# Altium schematic sheet BLE-Section.SchDoc
size A4; SheetNumber: 6; SheetTotal: 11
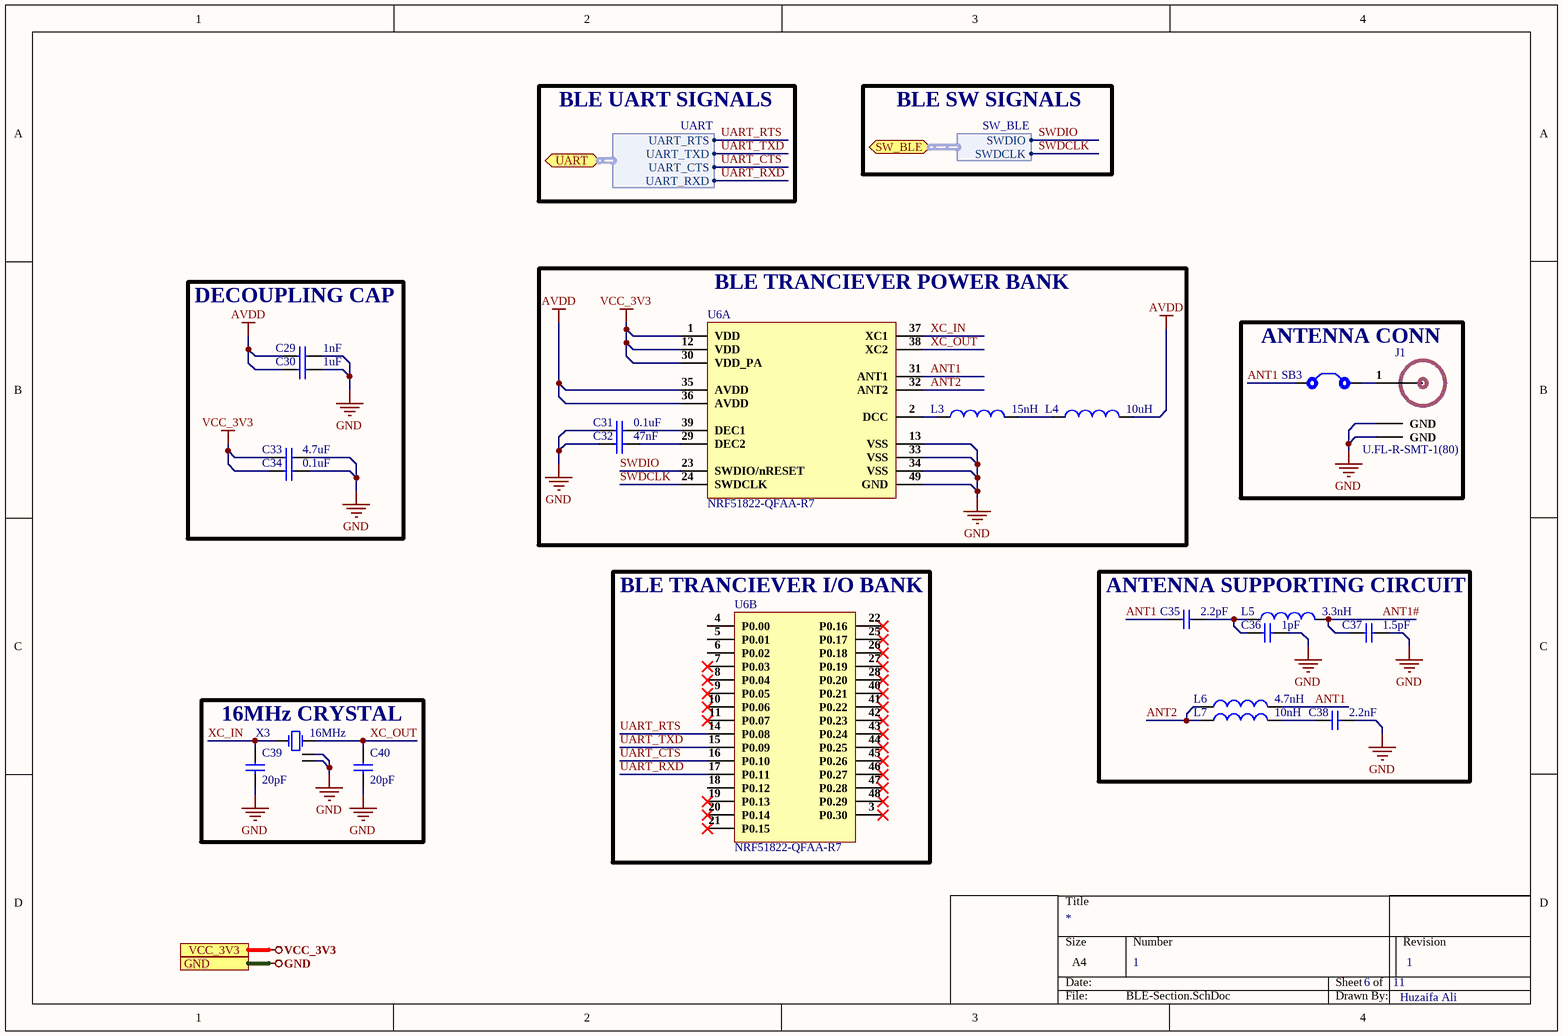
[diagram p0: BLE-Section.SchDoc]

## Parts
C29  1nF  [Cap 0402]
C30  1uF  [Cap 0402]
C31  0.1uF  [Cap 0402]
C32  47nF  [Cap 0402]
C33  4.7uF  [Cap 0402]
C34  0.1uF  [Cap 0402]
C35  2.2pF  [Cap 0402]
C36  1pF  [Cap 0402]
C37  1.5pF  [Cap 0402]
C38  2.2nF  [Cap 0402]
C39  20pF  [Cap 0402]
C40  20pF  [Cap 0402]
J1  U.FL-R-SMT-1(80)  [U.FL-R-SMT-1(80)]
L3  15nH  [SCW1608C15NJST]
L4  10uH  [Ind0805]
L5  3.3nH  [IND 0603]
L6  4.7nH  [IND 0603]
L7  10nH  [MHQ1005P10NGT000]
SB3  Solder Bridge  [Solder Bridge]  (value not drawn)
U6  NRF51822-QFAA-R7  [48-QFN (6x6)]  (parts A,B of 2)
X3  16MHz  [X322516MOB4SI]

## Blocks framed on the sheet
DECOUPLING CAP: C29 C30 C33 C34
BLE TRANCIEVER POWER BANK: C31 C32 L3 L4 U6
ANTENNA CONN: J1 SB3
BLE TRANCIEVER I/O BANK: U6
ANTENNA SUPPORTING CIRCUIT: C35-C38 L5-L7
16MHz CRYSTAL: C39 C40 X3

## Ports
GND, SW_BLE (bidir, harness SW_BLE), UART (bidir, harness UART), VCC_3V3

## Harnesses
SW_BLE: SWDIO, SWDCLK
UART: UART_RTS, UART_TXD, UART_CTS, UART_RXD

## Nets
AVDD: C29.1 C30.1 L4.2 U6.35(AVDD) U6.36(AVDD)
GND: C29.2 C30.2 C31.1 C32.1 C33.2 C34.2 C36.2 C37.2 C38.2 C39.1 C40.1 J1.2(GND) J1.3(GND) U6.13(VSS) U6.33(VSS) U6.34(VSS) U6.49(GND) X3.2(GND) X3.4(GND) ; port GND
VCC_3V3: C33.1 C34.1 U6.1(VDD) U6.12(VDD) U6.30(VDD_PA) ; port VCC_3V3
ANT1: C35.1 L6.2 SB3.1 U6.31(ANT1)
ANT1#: C37.1 L5.2
ANT2: L6.1 L7.1 U6.32(ANT2)
SWDCLK: U6.24(SWDCLK) ; port SW_BLE.SWDCLK
SWDIO: U6.23(SWDIO/nRESET) ; port SW_BLE.SWDIO
UART_CTS: U6.16(P0.10) ; port UART.UART_CTS
UART_RTS: U6.14(P0.08) ; port UART.UART_RTS
UART_RXD: U6.17(P0.11) ; port UART.UART_RXD
UART_TXD: U6.15(P0.09) ; port UART.UART_TXD
XC_IN: C39.2 U6.37(XC1) X3.1(OSC1)
XC_OUT: C40.2 U6.38(XC2) X3.3(OSC2)
NetC31_2: C31.2 U6.39(DEC1)
NetC32_2: C32.2 U6.29(DEC2)
NetC35_2: C35.2 C36.1 L5.1
NetC38_1: C38.1 L7.2
NetJ1_1: J1.1(RF_IN) SB3.2
NetL3_1: L3.1 U6.2(DCC)
NetL3_2: L3.2 L4.1

Not connected (* = marked no-connect by the designer): U6 3(P0.30)* 4(P0.00) 5(P0.01) 6(P0.02) 7(P0.03)* 8(P0.04)* 9(P0.05)* 10(P0.06)* 11(P0.07)* 18(P0.12) 19(P0.13)* 20(P0.14)* 21(P0.15)* 22(P0.16)* 25(P0.17)* 26(P0.18)* 27(P0.19)* 28(P0.20)* 40(P0.21)* 41(P0.22)* 42(P0.23)* 43(P0.24)* 44(P0.25)* 45(P0.26)* 46(P0.27)* 47(P0.28)* 48(P0.29)*

## Notes on the sheet
- BLE UART SIGNALS
- BLE SW SIGNALS
- 1
- Huzaifa Ali

## Library data of the parts
C29 = CC0402KRX7R8BB102: 0402 1 nF 25 V ±10 % Tolerance X7R SMT Multilayer Ceramic Capacitor; Manufacturer: Yageo; Manufacturer Part Number: CC0402JRNPO9BN200; Capacitance: 20pF; Tolerance: 5%; Voltage Rating: 50V; Dielectric: C0G; Dissipation Factor: 2.5%; Insulation Resistance: 10GR; Supplier 1: Digi-Key; Stock 1: 453493; Pricing 1: 1=0.1, 10=0.036, 100=0.0162, 500=0.01156, 1000=0.00908, 2500=0.00825, 5000=0.00759 (USD); Mount: Surface Mount; Case/Package: 0402; Number of Pins: 2; Weight: 2.3E-05oz; Case Code (Metric): 1005; Case Code (Imperial): 0402; Min Operating Temperature: -55°C; Max Operating Temperature: 125°C; Packaging: Tape and Reel; Package Quantity: 1; Voltage Rating (DC): 50V; Termination: SMD/SMT; Composition: Ceramic; Length: 1mm; Width: 0.02inch; Thickness: 0.022inch; Depth: 0.5mm; REACH SVHC: No SVHC; Lead Free: Lead Free; ComponentLink1URL: http://www.yageo.com/documents/recent/UPY-GP_NP0_16V-to-50V_16.pdf?src-supplier=Digi-Key; ComponentLink1Description: http://www.yageo.com/documents/recent/UPY-GP_NP0_16V-to-50V_16.pdf?src-supplier=Digi-Key; ComponentLink2URL: http://www.yageo.com/documents/recent/UPY-GP_NP0_16V-to-50V_16.pdf?src-supplier=Mouser; ComponentLink2Description: http://www.yageo.com/documents/recent/UPY-GP_NP0_16V-to-50V_16.pdf?src-supplier=Mouser; Supplier Part Number 1: 311-1417-1-ND; Supplier 2: Digi-Key; RoHS: Yes; Category: Ceramic Capacitors; Stock 2: 503749; Pricing 2: 1=0.10000, 10=0.02400, 50=0.01340, 100=0.01090, 500=0.00778, 1000=0.00611, 2500=0.00556, 5000=0.00511 (USD); Series: CC; Radiation Hardening: No; Halogen Free: Halogen Free; RoHS Compliant: Yes; ComponentLink3URL: https://datasheet.ciiva.com/26862/getdatasheetpartid-639817-26862638.pdf?src-supplier=Verical; ComponentLink3Description: https://datasheet.ciiva.com/26862/getdatasheetpartid-639817-26862638.pdf?src-supplier=Verical; ComponentLink4URL: https://datasheet.ciiva.com/5425/upy-gp-np0-16v-to-50v-8-3714-5425527.pdf?src-supplier=Mouser; ComponentLink4Description: https://datasheet.ciiva.com/5425/upy-gp-np0-16v-to-50v-8-3714-5425527.pdf?src-supplier=Mouser; Supplier Part Number 2: 311-1712-1-ND
C30 = CC0402KRX5R7BB105: CAP CER 1UF 16V X5R 0402; Manufacturer: Yageo; Tolerance: 10%; Supplier 1: Digi-Key; Manufacturer Part Number: CC0402KRX5R7BB105; Stock 1: 1405667; Pricing 1: 1=0.36, 10=0.252, 100=0.1512, 500=0.1134, 1000=0.09576, 2500=0.09072, 5000=0.08568 (USD); Mount: Surface Mount; Case/Package: 0402; Weight: 2.3E-05oz; Case Code (Imperial): 0402; Case Code (Metric): 1005; Min Operating Temperature: -55°C; Max Operating Temperature: 85°C; Capacitance: 1uF; Dielectric: X5R; Packaging: Tape and Reel; Voltage Rating (DC): 16V; Voltage Rating: 16V; Termination: SMD/SMT; Composition: Ceramic; Length: 1mm; Height: 0.5mm; Width: 0.02inch; Thickness: 0.022inch; Depth: 0.5mm; Radiation Hardening: No; Lead Free: Lead Free; Halogen Free: Halogen Free; ComponentLink1URL: http://www.yageo.com/documents/recent/UPY-GPHC_X5R_4V-to-50V_12.pdf?src-supplier=Avnet+Europe; ComponentLink1Description: http://www.yageo.com/documents/recent/UPY-GPHC_X5R_4V-to-50V_12.pdf?src-supplier=Avnet+Europe; Supplier Part Number 1: 311-1691-6-ND
C31 C34 = GRM155R71H104ME14D: CAP CER 0.1UF 50V X7R 0402; Manufacturer: Murata; Tolerance: 20%; Capacitance: 100nF; Supplier 1: Digi-Key; Manufacturer Part Number: GRM155R71H104ME14D; Stock 1: 439844; Pricing 1: 1=0.1, 10=0.038, 100=0.0168, 500=0.01198, 1000=0.00941, 2500=0.00855, 5000=0.00787 (USD); Mount: Surface Mount; Case/Package: 0402; Min Operating Temperature: -55°C; Max Operating Temperature: 125°C; Packaging: Cut Tape; Voltage Rating: 50V; Length: 0.039inch; Width: 0.02inch; Thickness: 0.022inch; ComponentLink1URL: http://search.murata.co.jp/Ceramy/image/img/A01X/G101/ENG/GRM155R71H104ME14-01.pdf?src-supplier=Digi-Key; ComponentLink1Description: http://search.murata.co.jp/Ceramy/image/img/A01X/G101/ENG/GRM155R71H104ME14-01.pdf?src-supplier=Digi-Key; ComponentLink2URL: http://psearch.en.murata.com/capacitor/product/GRM155R71H104ME14%23.pdf?src-supplier=Avnet; ComponentLink2Description: http://psearch.en.murata.com/capacitor/product/GRM155R71H104ME14%23.pdf?src-supplier=Avnet; ComponentLink3URL: http://components.arrow.com/part/dataview/0323_07177683?src-supplier=Arrow+Europe; ComponentLink3Description: http://components.arrow.com/part/dataview/0323_07177683?src-supplier=Arrow+Europe; ComponentLink4URL: http://www.mouser.com/ds/2/281/c02e-2905.pdf?src-supplier=Mouser; ComponentLink4Description: http://www.mouser.com/ds/2/281/c02e-2905.pdf?src-supplier=Mouser; Supplier Part Number 1: 490-10701-1-ND
C32 = C1005X7R473METS: 16V 47nF X7R ±20% 0402 Multilayer Ceramic Capacitors MLCC - SMD/SMT ROHS; Manufacture: Darfon Elec; ComponentLink1URL: http://www.yageo.com/documents/recent/UPY-GP_NP0_16V-to-50V_16.pdf?src-supplier=Digi-Key; ComponentLink1Description: http://www.yageo.com/documents/recent/UPY-GP_NP0_16V-to-50V_16.pdf?src-supplier=Digi-Key; ComponentLink2URL: http://www.yageo.com/documents/recent/UPY-GP_NP0_16V-to-50V_16.pdf?src-supplier=Mouser; ComponentLink2Description: http://www.yageo.com/documents/recent/UPY-GP_NP0_16V-to-50V_16.pdf?src-supplier=Mouser; ComponentLink3URL: http://www.mouser.com/ds/2/281/c02e-2905.pdf?src-supplier=Mouser; ComponentLink3Description: http://www.mouser.com/ds/2/281/c02e-2905.pdf?src-supplier=Mouser; ComponentLink4URL: http://search.murata.co.jp/Ceramy/image/img/A01X/G101/ENG/GRM155R61E225KE11-01.pdf?src-supplier=Digi-Key; ComponentLink4Description: http://search.murata.co.jp/Ceramy/image/img/A01X/G101/ENG/GRM155R61E225KE11-01.pdf?src-supplier=Digi-Key; ComponentLink5URL: http://search.murata.co.jp/Ceramy/image/img/A01X/partnumbering_e_01.pdf?src-supplier=Digi-Key; ComponentLink5Description: http://search.murata.co.jp/Ceramy/image/img/A01X/partnumbering_e_01.pdf?src-supplier=Digi-Key; ComponentLink6URL: http://psearch.en.murata.com/capacitor/product/GRM155R61E225KE11%23.pdf?src-supplier=Avnet; ComponentLink6Description: http://psearch.en.murata.com/capacitor/product/GRM155R61E225KE11%23.pdf?src-supplier=Avnet; Manufacturer Part no:: C1005X7R473METS; Package: Cap 0402`; Value: 47nF
C33 = EDK105BBJ475MVLF: 16V 4.7uF ±20% 0402 Multilayer Ceramic Capacitors MLCC
C35 = GCM1555C1H2R2WA16D: CAP CER 2.2PF 50VDC C0G 0.05PF SMD 0402; Manufacturer: Murata; Supplier 1: Mouser; Manufacturer Part Number: GCM1555C1H2R2WA16D; RoHS: Yes; Category: Ceramic Capacitors; Stock 1: 14337; Pricing 1: 1=0.23000, 10=0.15400, 50=0.15400, 100=0.07900, 1000=0.04800, 10000=0.03900 (USD); RoHS Compliant: Yes; Supplier Part Number 1: 81-GCM1555C1H2R2WA6D
C36 = GRM1555C1H1R0CA01D: 0402 1 pF 50 V ±0.25 pF Tolerance C0G SMT Multilayer Ceramic Capacitor; Manufacturer: Murata; Voltage Rating: 50V; Supplier 1: Digi-Key; Manufacturer Part Number: GRM1555C1H1R0CA01D; RoHS: Yes; Category: Ceramic Capacitors; Stock 1: 594883; Pricing 1: 1=0.10000, 10=0.02200, 50=0.01200, 100=0.00980, 500=0.00700, 1000=0.00551, 2500=0.00500, 5000=0.00460 (USD); Mount: Surface Mount; Case/Package: 0402; Case Code (Metric): 1005; Case Code (Imperial): 0402; Material: Ceramic; Min Operating Temperature: -55°C; Max Operating Temperature: 125°C; Package Quantity: 1; Capacitance: 1pF; Packaging: Tape and Reel; Voltage Rating (DC): 50V; Dielectric: C0G; Termination: SMD/SMT; Voltage: 50V; Series: GRM; Construction: Flat; Length: 1mm; Width: 0.02inch; Height: 0.5mm; Thickness: 0.022inch; Depth: 0.5mm; Radiation Hardening: No; REACH SVHC: No SVHC; Lead Free: Lead Free; RoHS Compliant: Yes; ComponentLink1URL: https://datasheet.ciiva.com/129/l0005e-129856.pdf?src-supplier=Digi-Key; ComponentLink1Description: https://datasheet.ciiva.com/129/l0005e-129856.pdf?src-supplier=Digi-Key; ComponentLink2URL: https://datasheet.ciiva.com/2989/product-2989298.pdf?src-supplier=Avnet; ComponentLink2Description: https://datasheet.ciiva.com/2989/product-2989298.pdf?src-supplier=Avnet; ComponentLink3URL: https://datasheet.ciiva.com/3777/7011grm1555c1h1r0ca0123-3777832.pdf?src-supplier=Arrow+Electronics; ComponentLink3Description: https://datasheet.ciiva.com/3777/7011grm1555c1h1r0ca0123-3777832.pdf?src-supplier=Arrow+Electronics; ComponentLink4URL: https://datasheet.ciiva.com/18184/getdatasheetpartid-248063-18184221.pdf?src-supplier=Verical; ComponentLink4Description: https://datasheet.ciiva.com/18184/getdatasheetpartid-248063-18184221.pdf?src-supplier=Verical; ComponentLink5URL: https://datasheet.ciiva.com/29200/453661-da-01-en-vs-kondensator-0402-29200026.pdf?src-supplier=Conrad; ComponentLink5Description: https://datasheet.ciiva.com/29200/453661-da-01-en-vs-kondensator-0402-29200026.pdf?src-supplier=Conrad; ComponentLink6URL: https://datasheet.ciiva.com/22698/1666664-22698395.pdf?src-supplier=Element14; ComponentLink6Description: https://datasheet.ciiva.com/22698/1666664-22698395.pdf?src-supplier=Element14; ComponentLink7URL: https://datasheet.ciiva.com/129/partnumbering-e-01-129855.pdf?src-supplier=Digi-Key; ComponentLink7Description: https://datasheet.ciiva.com/129/partnumbering-e-01-129855.pdf?src-supplier=Digi-Key; ComponentLink8URL: https://datasheet.ciiva.com/129/partnumbering-e-01-129857.pdf?src-supplier=Digi-Key; ComponentLink8Description: https://datasheet.ciiva.com/129/partnumbering-e-01-129857.pdf?src-supplier=Digi-Key; ComponentLink9URL: https://datasheet.ciiva.com/16440/product-16440570.pdf?src-supplier=Future+Electronics; ComponentLink9Description: https://datasheet.ciiva.com/16440/product-16440570.pdf?src-supplier=Future+Electronics; Supplier Part Number 1: 490-3199-6-ND
C37 = GRM1555C1H1R5BA01D: CAP CER 1.5PF 50V C0G/NP0 0402; Manufacturer: Murata; Material: Ceramic; Dielectric: C0G; Temperature Coefficient: 30ppm/°C; Supplier 1: Digi-Key; Manufacturer Part Number: GRM1555C1H1R5BA01D; RoHS: Yes; Category: Ceramic Capacitors; Stock 1: 395794; Pricing 1: 1=0.10000, 10=0.05300, 50=0.02900, 100=0.02370, 500=0.01694, 1000=0.01331, 2500=0.01210, 5000=0.01113 (USD); Mount: Surface Mount; Case/Package: 0402; Case Code (Metric): 1005; Case Code (Imperial): 0402; Min Operating Temperature: -55°C; Max Operating Temperature: 125°C; Capacitance: 1.5pF; Packaging: Tape and Reel; Voltage Rating (DC): 50V; Voltage: 50V; Voltage Rating: 50V; Package Quantity: 10000; Termination: SMD/SMT; Series: GRM; Construction: Flat; Length: 1mm; Width: 0.5mm; Height: 0.5mm; Thickness: 0.022inch; Depth: 0.5mm; Radiation Hardening: No; REACH SVHC: Unknown; Lead Free: Lead Free; RoHS Compliant: Yes; ComponentLink1URL: https://datasheet.ciiva.com/6270/grm1555c1h1r5ba01-01-6270901.pdf?src-supplier=Digi-Key; ComponentLink1Description: https://datasheet.ciiva.com/6270/grm1555c1h1r5ba01-01-6270901.pdf?src-supplier=Digi-Key; ComponentLink2URL: https://datasheet.ciiva.com/6270/partnumbering-e-01-6270904.pdf?src-supplier=Digi-Key; ComponentLink2Description: https://datasheet.ciiva.com/6270/partnumbering-e-01-6270904.pdf?src-supplier=Digi-Key; ComponentLink3URL: https://datasheet.ciiva.com/6270/partnumbering-e-01-6270907.pdf?src-supplier=Digi-Key; ComponentLink3Description: https://datasheet.ciiva.com/6270/partnumbering-e-01-6270907.pdf?src-supplier=Digi-Key; ComponentLink4URL: https://datasheet.ciiva.com/11615/product-11615786.pdf?src-supplier=Avnet; ComponentLink4Description: https://datasheet.ciiva.com/11615/product-11615786.pdf?src-supplier=Avnet; Supplier Part Number 1: 490-6212-1-ND
C38 = CC0402KRX7R9BB222: CC Series 0402 2.2 nF 50 V ±10 % Tolerance X7R Multilayer Ceramic Capacitor; Manufacturer: Yageo; Tolerance: 10%; Voltage Rating: 50V; Insulation Resistance: 100GR; Supplier 1: Arrow Electronics; Manufacturer Part Number: CC0402KRX7R9BB222; RoHS: Yes; Category: Ceramic Capacitors; Stock 1: 492; Pricing 1: 1=0.04710, 10=0.02620, 25=0.01600, 100=0.00850, 250=0.00840 (USD); Mount: Surface Mount; Case/Package: 0402; Number of Pins: 2; Case Code (Imperial): 0402; Case Code (Metric): 1005; Weight: 2.3E-05oz; Dielectric Material: Ceramic; Min Operating Temperature: -55°C; Max Operating Temperature: 125°C; Capacitance: 2.2nF; Dielectric: X7R; Voltage Rating (DC): 50V; Packaging: Tape and Reel; Package Quantity: 1; Termination: SMD/SMT; Resistor Type: Ceramic; Series: CC; Length: 1mm; Width: 0.5mm; Height: 0.5mm; Depth: 0.5mm; Thickness: 0.022inch; Radiation Hardening: No; RoHS Compliant: Yes; REACH SVHC: No SVHC; Lead Free: Lead Free; Halogen Free: Halogen Free; ComponentLink1URL: https://datasheet.ciiva.com/26862/getdatasheetpartid-315909-26862649.pdf?src-supplier=Verical; ComponentLink1Description: https://datasheet.ciiva.com/26862/getdatasheetpartid-315909-26862649.pdf?src-supplier=Verical; ComponentLink2URL: https://datasheet.ciiva.com/8033/70765-8033626.pdf?src-supplier=Element14; ComponentLink2Description: https://datasheet.ciiva.com/8033/70765-8033626.pdf?src-supplier=Element14; ComponentLink3URL: https://datasheet.ciiva.com/8033/1489800-8033625.pdf?src-supplier=Element14; ComponentLink3Description: https://datasheet.ciiva.com/8033/1489800-8033625.pdf?src-supplier=Element14; ComponentLink4URL: https://datasheet.ciiva.com/8033/1489800-8033627.pdf?src-supplier=Element14; ComponentLink4Description: https://datasheet.ciiva.com/8033/1489800-8033627.pdf?src-supplier=Element14; ComponentLink5URL: https://datasheet.ciiva.com/155/mlccorderingcode-155867.pdf?src-supplier=Digi-Key; ComponentLink5Description: https://datasheet.ciiva.com/155/mlccorderingcode-155867.pdf?src-supplier=Digi-Key; ComponentLink6URL: https://datasheet.ciiva.com/155/mlccorderingcode-155866.pdf?src-supplier=Digi-Key; ComponentLink6Description: https://datasheet.ciiva.com/155/mlccorderingcode-155866.pdf?src-supplier=Digi-Key; ComponentLink7URL: https://datasheet.ciiva.com/155/mlccorderingcode-155868.pdf?src-supplier=Digi-Key; ComponentLink7Description: https://datasheet.ciiva.com/155/mlccorderingcode-155868.pdf?src-supplier=Digi-Key; ComponentLink8URL: https://datasheet.ciiva.com/11464/upy-gphc-x7r-6-3v-to-50v-8-11464903.pdf?src-supplier=Avnet; ComponentLink8Description: https://datasheet.ciiva.com/11464/upy-gphc-x7r-6-3v-to-50v-8-11464903.pdf?src-supplier=Avnet; Supplier Part Number 1: CC0402KRX7R9BB222
C39 C40 = CC0402JRNPO9BN200: CAP CER 20PF 50V C0G/NPO 0402; Manufacturer: Yageo; Tolerance: 5%; Dielectric: C0G; Supplier 1: Digi-Key; Manufacturer Part Number: CC0402JRNPO9BN200; Stock 1: 453493; Pricing 1: 1=0.1, 10=0.036, 100=0.0162, 500=0.01156, 1000=0.00908, 2500=0.00825, 5000=0.00759 (USD); Mount: Surface Mount; Case/Package: 0402; Number of Pins: 2; Weight: 2.3E-05oz; Case Code (Metric): 1005; Case Code (Imperial): 0402; Min Operating Temperature: -55°C; Max Operating Temperature: 125°C; Capacitance: 20pF; Voltage Rating: 50V; Packaging: Tape and Reel; Package Quantity: 1; Voltage Rating (DC): 50V; Termination: SMD/SMT; Composition: Ceramic; Length: 1mm; Width: 0.02inch; Thickness: 0.022inch; Depth: 0.5mm; REACH SVHC: No SVHC; Lead Free: Lead Free; ComponentLink1URL: http://www.yageo.com/documents/recent/UPY-GP_NP0_16V-to-50V_16.pdf?src-supplier=Digi-Key; ComponentLink1Description: http://www.yageo.com/documents/recent/UPY-GP_NP0_16V-to-50V_16.pdf?src-supplier=Digi-Key; ComponentLink2URL: http://www.yageo.com/documents/recent/UPY-GP_NP0_16V-to-50V_16.pdf?src-supplier=Mouser; ComponentLink2Description: http://www.yageo.com/documents/recent/UPY-GP_NP0_16V-to-50V_16.pdf?src-supplier=Mouser; Supplier Part Number 1: 311-1417-1-ND
J1 = U.FL-R-SMT-1(80): CONN U.FL RCPT STR 50 OHM SMD; Manufacturer: Hirose; Supplier 1: Future Electronics; Manufacturer Part Number: U.FL-R-SMT-1(80); Stock 1: 1272; Pricing 1: 1=1.07, 500=0.785, 1500=0.74, 2500=0.72, 5000=0.695 (USD); Case/Package: SMD/SMT; Package Quantity: 10000; Packaging: Tape and Reel; Lead Free: Lead Free; ComponentLink1URL: https://www.hirose.com/product/en/download_file/key_name/U.FL-R-SMT-1%2880%29/category/Specification%20Sheet/doc_file_id/37638/?file_category_id=9&item_id=03310472280&is_series=&src-supplier=Digi-Key; ComponentLink1Description: https://www.hirose.com/product/en/download_file/key_name/U.FL-R-SMT-1%2880%29/category/Specification%20Sheet/doc_file_id/37638/?file_category_id=9&item_id=03310472280&is_series=&src-supplier=Digi-Key; ComponentLink2URL: http://www.mouser.com/ds/2/185/U.FL_catalog-939761.pdf?src-supplier=Mouser; ComponentLink2Description: http://www.mouser.com/ds/2/185/U.FL_catalog-939761.pdf?src-supplier=Mouser; Supplier Part Number 1: U.FL-R-SMT-1(80)-CUTT
L3 = SCW1608C15NJST: 550mA 15nH ±5% 150mΩ SMD,1.68x1x0.85mm Inductors (SMD) ROHS
L4 = MGFL2012F100MT-LF: 500mA 10uH ±20% 320mΩ 0805 Inductors (SMD) ROHS; Manufacturer: microgate; Manufacturer Part no:: MGFL2012F100MT-LF; Package: IND 0805; Value: 10uH
L5 = MGCI1608H3N3ST-LF: 500mA 3.3nH ±0.3nH 120mΩ 0603 Inductors (SMD) ROHS; Manufacturer: microgate; Manufacturer Part no:: MGCI1608H3N3ST-LF; Package: IND 0603; Value: 3.3nH
L6 = CH1608H4N7S(f): 500mA 4.7nH ±0.3nH 200mΩ 0603 Inductors (SMD) ROHS; Manufacturer: CEC; Manufacturer Part no:: CH1608H4N7S(f); Package: IND 0603; Value: 4.7nH
L7 = MHQ1005P10NGT000: IND SMD 0.01uH 2% 100MHz 0.5A 0.19Ohm DCR 0402 T/R; Manufacturer: TDK; Core Material: Non-Magnetic; Current Rating: 500mA; Shielding: Unshielded; DC Resistance (DCR): 190mR; Self Resonant Frequency: 3.3GHz; Supplier 1: Mouser; Manufacturer Part Number: MHQ1005P10NGT000; RoHS: Yes; Category: Fixed Inductors; Stock 1: 13345; Pricing 1: 1=0.21000, 10=0.14000, 50=0.14000, 100=0.11300, 1000=0.08700, 10000=0.06500 (USD); Mount: Surface Mount; Case/Package: 0402; Min Operating Temperature: -55°C; Max Operating Temperature: 125°C; Package Quantity: 10000; Packaging: Tape and Reel; Tolerance: 2%; Inductance: 10nH; Test Frequency: 100MHz; Length: 0.039inch; Width: 0.024inch; Height - Seated (Max): 0.024inch; RoHS Compliant: Yes; ComponentLink1URL: https://datasheet.ciiva.com/29693/inductor-commercial-high-frequency-mhq-en-29693629.pdf?src-supplier=Digi-Key; ComponentLink1Description: https://datasheet.ciiva.com/29693/inductor-commercial-high-frequency-mhq-en-29693629.pdf?src-supplier=Digi-Key; Supplier Part Number 1: 810-MHQ1005P10NGT000
SB3 = Solder Bridge: Solder Bridge ON
U6 = NRF51822-QFAA-R7: IC RF TXRX+MCU BLUETOOTH 48VFQFN; Manufacturer: Nordic Semiconductor; Interface: SPI,UART,2-Wire,I2C; Operating Supply Voltage: 3.6V; Frequency: 2.4GHz; Data Rate: 2000Kbps; RAM Size: 16KB; Data Bus Width: 32b; Number of Timers/Counters: 2; Sensitivity: -96dBm; Number of GPIO: 32; Memory Type: FLASH; Current - Receiving: 13.4mA; Current - Transmitting: 16mA; Core Architecture: ARM; Operating Frequency: 2.4 GHz; Output Power (dBm): -20dBm; Supplier 1: Newark; Manufacturer Part Number: nRF51822-QFAA-R7; RoHS: Yes; Category: RF Receivers, Transceivers; Stock 1: 838; Pricing 1: 1=6.95000, 10=6.25000 (USD); Case/Package: QFN; Number of Pins: 48; Weight: 0.005309oz; Min Operating Temperature: -25°C; Max Operating Temperature: 75°C; Package Quantity: 1000; Packaging: Tape and Reel; Memory Size: 16KB; Series: -; RoHS Compliant: Yes; ComponentLink1URL: https://datasheet.ciiva.com/29856/prod+brief+nrf51822+v2-1-29856539.pdf?src-supplier=Digi-Key; ComponentLink1Description: https://datasheet.ciiva.com/29856/prod+brief+nrf51822+v2-1-29856539.pdf?src-supplier=Digi-Key; ComponentLink2URL: https://datasheet.ciiva.com/29856/prod+brief+nrf51822+v2-1-29856540.pdf?src-supplier=Digi-Key; ComponentLink2Description: https://datasheet.ciiva.com/29856/prod+brief+nrf51822+v2-1-29856540.pdf?src-supplier=Digi-Key; ComponentLink3URL: https://datasheet.ciiva.com/29856/prod+brief+nrf51822+v2-1-29856541.pdf?src-supplier=Digi-Key; ComponentLink3Description: https://datasheet.ciiva.com/29856/prod+brief+nrf51822+v2-1-29856541.pdf?src-supplier=Digi-Key; Supplier Part Number 1: 50AC6438
X3 = X322516MOB4SI: 16MHz SMD Crystal Resonator 12pF ±10ppm ±30ppm -40℃~+85℃ SMD3225-4P Crystals ROHS; Manufacturer: Yangxing Tech; Package: SMD3225-4P; Frequency: 16MHz; Crystal Type: SMD Crystal Resonator; Frequency Tolerance: ±10ppm; Load Capacitance: 12pF; Operating Temperature: -40℃~+85℃